# Altium project Proyect Power Supply.PrjPcb
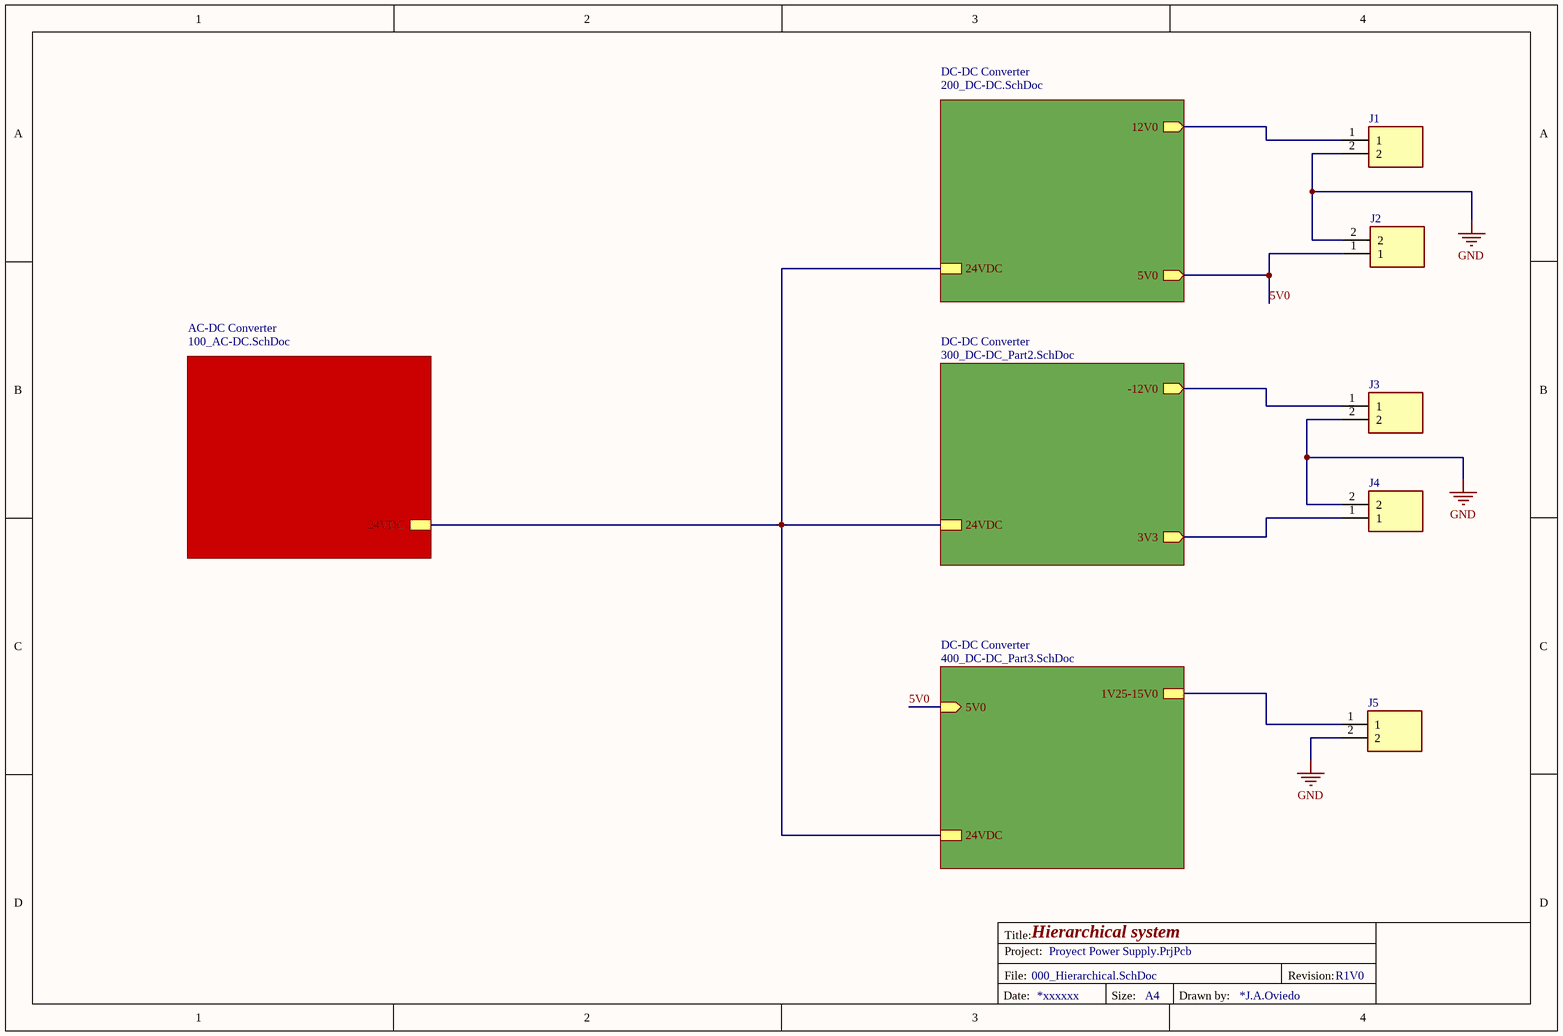
[diagram p0: 000_Hierarchical.SchDoc]
5 sheets, 85 parts. Net scope: hierarchical (ports join the sheet entries above them; power ports are global).
Board file: Main_PCB_V1R0_XXXXXX.PcbDoc
Sheets:
  000_Hierarchical.SchDoc
    AC-DC Converter = 100_AC-DC.SchDoc
    DC-DC Converter = 200_DC-DC.SchDoc
    DC-DC Converter = 300_DC-DC_Part2.SchDoc
    DC-DC Converter = 400_DC-DC_Part3.SchDoc

## Sheet 000_Hierarchical.SchDoc: Hierarchical system
size A4; Date: *xxxxxx; DrawnBy: *J.A.Oviedo; Revision: R1V0; SheetNumber: 1; SheetTotal: 5

### Parts
J1  Con_2*1_TH_5mm_14.3*10.5_300V_15A  [Con_2*1_TH_5mm_14.3*10.5_300V_15A]  (value not drawn)
J2  Con_2*1_TH_5mm_14.3*10.5_300V_15A  [Con_2*1_TH_5mm_14.3*10.5_300V_15A]  (value not drawn)
J3  Con_2*1_TH_5mm_14.3*10.5_300V_15A  [Con_2*1_TH_5mm_14.3*10.5_300V_15A]  (value not drawn)
J4  Con_2*1_TH_5mm_14.3*10.5_300V_15A  [Con_2*1_TH_5mm_14.3*10.5_300V_15A]  (value not drawn)
J5  Con_2*1_TH_5mm_14.3*10.5_300V_15A  [Con_2*1_TH_5mm_14.3*10.5_300V_15A]  (value not drawn)

### Sub-sheets
AC-DC Converter = 100_AC-DC.SchDoc: 24VDC
DC-DC Converter = 200_DC-DC.SchDoc: 24VDC, 12V0 (out), 5V0 (out)
DC-DC Converter = 300_DC-DC_Part2.SchDoc: 24VDC, -12V0 (out), 3V3 (out)
DC-DC Converter = 400_DC-DC_Part3.SchDoc: 24VDC, 1V25-15V0, 5V0 (in)

### Nets
GND: J1.2 J2.2 J3.2 J4.2 J5.2
5V0: J2.1 ; sheet DC-DC Converter/5V0, sheet DC-DC Converter/5V0
NetC104_1: sheet AC-DC Converter/24VDC, sheet DC-DC Converter/24VDC, sheet DC-DC Converter/24VDC, sheet DC-DC Converter/24VDC
NetC204_1: J1.1 ; sheet DC-DC Converter/12V0
NetC305_2: J3.1 ; sheet DC-DC Converter/-12V0
NetC310_1: J4.1 ; sheet DC-DC Converter/3V3
NetC401_2: J5.1 ; sheet DC-DC Converter/1V25-15V0

### Notes on the sheet
- Title:
- Project:
- File:
- Revision:
- Date:
- Size:
- A4
- Drawn by:

### Library data of the parts
J1-J5 = Con_2*1_TH_5mm_14.3*10.5_300V_15A: 2 Bloques de terminales - Cable a placa Horizontal con placa 0.197" (5.00mm) Orificio pasante; Manufacturer: Same Sky (Formerly CUI Devices); Manufacturer Part Number: TB002-500-02BE; Supplier 1: Digi-key; Supplier Part Number 1: 102-6145-ND; Reel Stock: N/A; Last modified by: J.A.Oviedo; Last modified date: 20261021

## Sheet 100_AC-DC.SchDoc: AC-DC Convertion stage
size A4; Date: xxxxxx; DrawnBy: J.A.Oviedo; Revision: R1V1; SheetNumber: 2; SheetTotal: 5
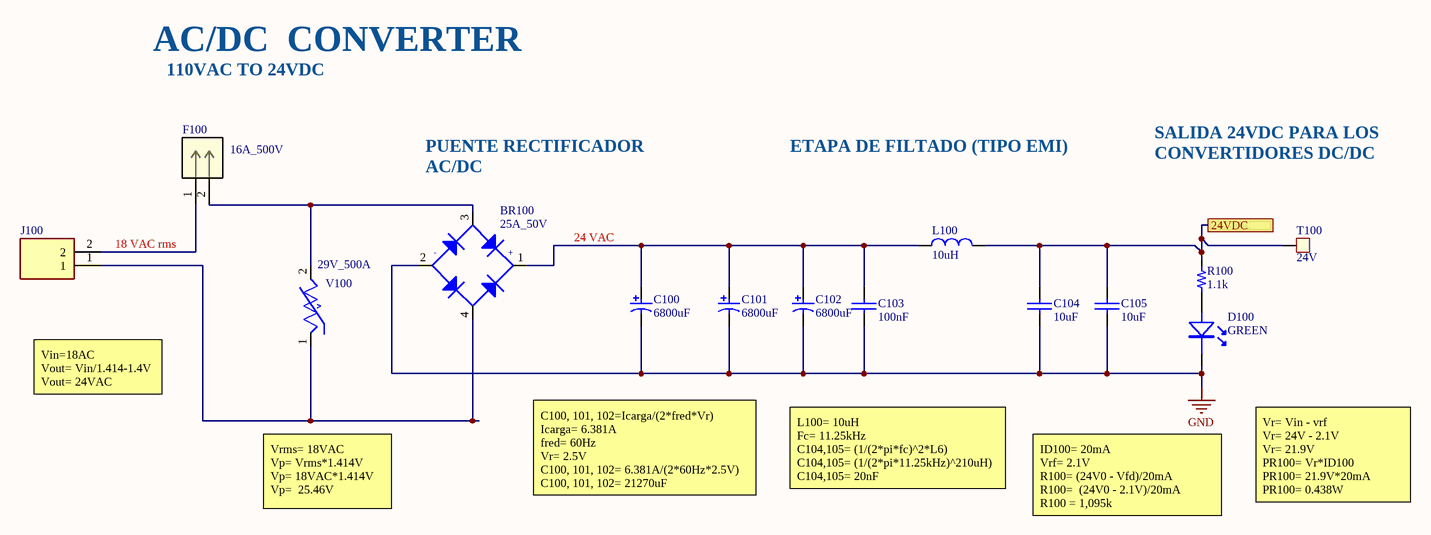
[diagram p1: 100_AC-DC.SchDoc]

### Parts
BR100  25A_50V  [BR_25A_50V_GBJ_Bridge]
C100  value 6800uF  [Cap_6800uF_TH_25*40_50V]  (hidden comment: 6800uF_50V)
C101  value 6800uF  [Cap_6800uF_TH_25*40_50V]  (hidden comment: 6800uF_50V)
C102  value 6800uF  [Cap_6800uF_TH_25*40_50V]  (hidden comment: 6800uF_50V)
C103  value 100nF  [Cap_100nF_X7R-RADIAL_50V]  (hidden comment: 100nF_50V)
C104  value 10uF  [Cap_10uF_X7R_RADIAL_50V]  (hidden comment: 10uF_50V)
C105  value 10uF  [Cap_10uF_X7R_RADIAL_50V]  (hidden comment: 10uF_50V)
D100  GREEN  [LED_TH_5MM_GREEN]
F100  16A_500V  [F_16A_500V_Cartridge_5x20mm_OGN]
J100  Con_2*1_TH_5mm_14.3*10.5_300V_15A  [Con_2*1_TH_5mm_14.3*10.5_300V_15A]  (value not drawn)
L100  value 10uH  [3L_10uH_10A_THT_25*3]  (hidden comment: 10uH_10A)
R100  value 1.1k  [Res_1k1_TH_0.5W]  (hidden comment: 1k1_0.5W)
T100  24V  [TP_SMD_45mil]  (no BOM)
V100  29V_500A  [Var_29V_500A_TH_DISC_10MM]

### Ports
24VDC (see 000_Hierarchical[2C], 200_DC-DC[1A], 300_DC-DC_Part2[1A], 400_DC-DC_Part3[1B])

### Nets
GND: BR100.2 C100.2 C101.2 C102.2 C103.2 C104.2 C105.2 D100.2(K)
NetBR100_1: BR100.1 C100.1 C101.1 C102.1 C103.1 L100.1
NetBR100_3: BR100.3 F100.2 V100.2
NetBR100_4: BR100.4 J100.1 V100.1
NetC104_1: C104.1 C105.1 L100.2 R100.2 T100.1 ; port 24VDC
NetD100_1: D100.1(A) R100.1
NetF100_1: F100.1 J100.2

### Notes on the sheet
- AC/DC  CONVERTER
- 110VAC TO 24VDC
- SALIDA 24VDC PARA LOS
- PUENTE RECTIFICADOR
- (near BR100) AC/DC
- ETAPA DE FILTADO (TIPO EMI)
- CONVERTIDORES DC/DC
- 18 VAC rms
- 24 VAC
- Vin=18AC                                                                                   Vout= Vin/1.414-1.4V
  Vout= 24VAC
- Vrms= 18VAC
  Vp= Vrms*1.414V
  Vp= 18VAC*1.414V
  Vp=  25.46V
- C100, 101, 102=Icarga/(2*fred*Vr)
  Icarga= 6.381A
  fred= 60Hz
  Vr= 2.5V
  C100, 101, 102= 6.381A/(2*60Hz*2.5V)
  C100, 101, 102= 21270uF
- L100= 10uH
  Fc= 11.25kHz
  C104,105= (1/(2*pi*fc)^2*L6)
  C104,105= (1/(2*pi*11.25kHz)^210uH)
  C104,105= 20nF
- ID100= 20mA
  Vrf= 2.1V
  R100= (24V0 - Vfd)/20mA
  R100=  (24V0 - 2.1V)/20mA
  R100 = 1,095k
- Vr= Vin - vrf
  Vr= 24V - 2.1V
  Vr= 21.9V
  PR100= Vr*ID100
  PR100= 21.9V*20mA
  PR100= 0.438W
- Title:
- Project:
- File:
- Revision:
- Date:
- Size:
- A4
- Drawn by:
- (in symbol BR_25A_50V_GBJ_Bridge) -; +

### Library data of the parts
BR100 = BR_25A_50V_GBJ_Bridge: BRIDGE RECT 1PHASE 50V 25A TS-6P; Manufacturer: onsemi; Manufacturer Part Number: DFB2505; Supplier 1: Digi-Key; Supplier Part Number 1: DFB2505-ND; Reel Stock: N/A; Last modified by: J.A.Oviedo; Last modified date: 20261022; ComponentLink1Description: Digi-Key; ComponentLink1URL: https://www.digikey.com/product-detail/en/smc-diode-solutions/KMB24STR/1655-1884-1-ND/7898353
C100-C102 = Cap_6800uF_TH_25*40_50V: CAP ALUM 6800UF 20% 50V SNAP TH; Manufacturer: Cornell Dubilier Knowles; Manufacturer Part Number: SLPX682M050C7P3; Last modified by: J.A.Oviedo; Last modified date: 2026/10/22; ComponentLink1Description: Digi-Key; ComponentLink1URL: https://www.digikey.com/products/en?keywords=493-10137-1-ND; Supplier 1: Digi-Key; Supplier Part Number 1: SLPX682M050C7P3
C103 = Cap_100nF_X7R-RADIAL_50V: CAP CER 0.1UF 50V X7R RADIAL; Manufacturer: KEMET; Manufacturer Part Number: C320C104K5R5TA; Supplier 1: Digi-Key; Supplier Part Number 1: 399-4264-ND; Last modified by: J.A.Oviedo; Last modified date: 20261022
C104 C105 = Cap_10uF_X7R_RADIAL_50V: 10 µF ±10% 50V Capacitores cerámicos X7R Radial; Manufacturer: TDK; Manufacturer Part Number: FG20X7R1H106KRT06; Supplier 1: Digi-Key; Supplier Part Number 1: 445-173297-1-ND; Last modified by: J.A.Oviedo; Last modified date: 20261022
D100 = LED_TH_5MM_GREEN: LED GREEN DIFFUSED 5MM ROUND T/H; Manufacturer: Würth Elektronik; Manufacturer Part Number: 151051VS04000; Supplier 1: Digi-key; Supplier Part Number 1: 732-5017-ND; Last modified by: J.A.Oviedo; Last modified date: 20261022; Reel Stock: N/A; ComponentLink1Description: Digi-key; ComponentLink1URL: https://www.digikey.tw/products/en?keywords=511-1635-1-ND
F100 = F_16A_500V_Cartridge_5x20mm_OGN: Fusible Bloque 16 A 500V 1 Circuitos Cartucho Orificio pasante; Manufacturer: SCHURTER Inc.; Manufacturer Part Number: 3-132-874; Supplier 1: Digi-key; Supplier Part Number 1: 486-3-132-874-ND; Reel Sotck: N/A; Last modified by: J.A.Oviedo; Last modified date: 20261021
J100 = Con_2*1_TH_5mm_14.3*10.5_300V_15A: as J1 on sheet 000_Hierarchical; Supplier 1: Digi-key; Supplier Part Number 1: 102-6145-ND; Reel Stock: N/A; Last modified by: J.A.Oviedo; Last modified date: 20261021
L100 = L_10uH_10A_THT_25*3: 10 µH No blindado Núcleo de tambor, cableado Inductivo 10 A 8.8mOhm Cilindro radial y horizontal (abierto); Manufacturer: Würth Elektronik; Manufacturer Part Number: 744711010; Supplier 1: Digy-key; Supplier Part Number 1: 732-3259-ND; Reel Stock: N/A; Last modified by: J.A.Oviedo; Last modified date: 20261022
R100 = Res_1k1_TH_0.5W: RES 1.1kΩ ±1% 500mW Through Hole,D2.4xL6.3mm; Manufacturer: YAGEO; Manufacturer Part Number: MFR50SFTE52-1K1; Supplier 1: LCSC; Supplier Part Number 1: YAGEO MFR50SFTE52-1K1; Reel Stock: N/A; Last modified by: J.A.Oviedo; Last modified date: 20261023
T100 = TP_SMD_45mil: Test point 45mil pad size; Last modified by: J.Jaramillo; Last modified date: 20240310
V100 = Var_29V_500A_TH_DISC_10MM: 39 V 500 A Varistor 1 Circuitos Orificio pasante Tipo moneda 10mm; Manufacturer: TDK; Manufacturer Part Number: B72210S0250K101; Supplier 1: Digi-key; Supplier Part Number 1: 495-3768-ND; Reel Sotck: N/A; Last modified by: J.Jaramillo; Last modified date: 20240309

## Sheet 200_DC-DC.SchDoc: DC-DC Convertion stage
size A4; Date: xxxxxx; DrawnBy: J.A.Oviedo; Revision: R1V1; SheetNumber: 3; SheetTotal: 5
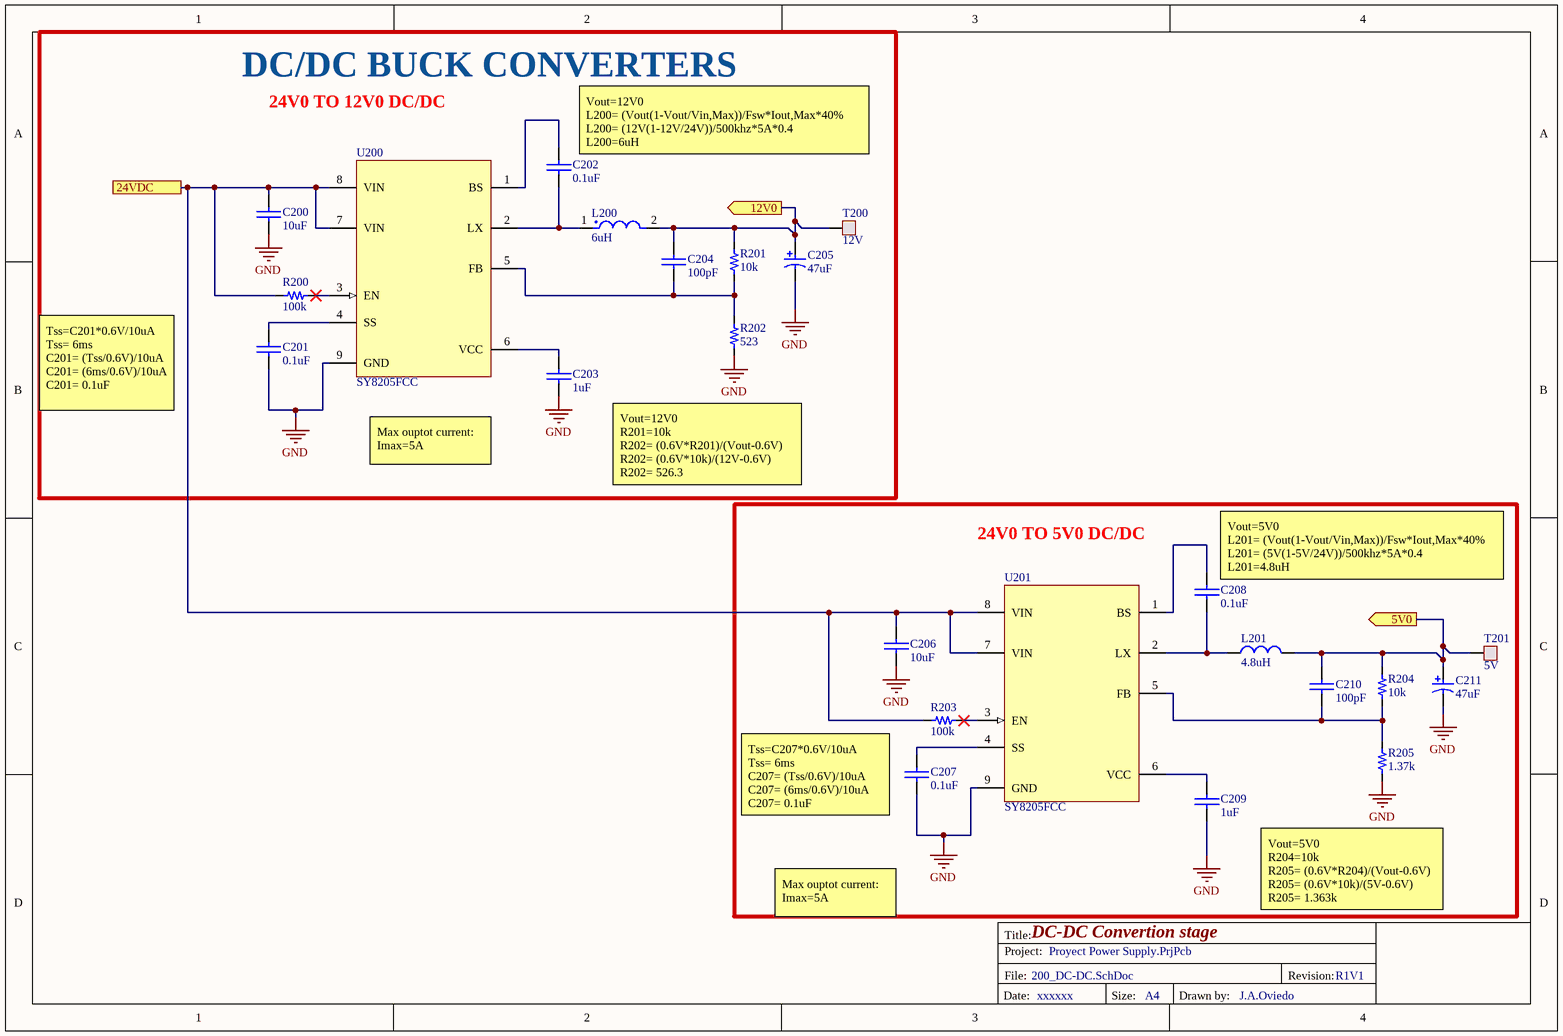
[diagram p2: 200_DC-DC.SchDoc]

### Parts
C200  value 10uF  [1206]  (hidden comment: 10uF 50V)
C201  value 0.1uF  [0603]  (hidden comment: 0.1uF 50V)
C202  value 0.1uF  [0603]  (hidden comment: 0.1uF 50V)
C203  value 1uF  [0805]  (hidden comment: 1uF 25V)
C204  value 100pF  [0201]  (hidden comment: 100pF 25V)
C205  value 47uF  [RADIAL-CAN_LSx2.54mm_Diax6.35mm]  (hidden comment: 47uF 25V)
C206  value 10uF  [1206]  (hidden comment: 10uF 50V)
C207  value 0.1uF  [0603]  (hidden comment: 0.1uF 50V)
C208  value 0.1uF  [0603]  (hidden comment: 0.1uF 50V)
C209  value 1uF  [0805]  (hidden comment: 1uF 25V)
C210  value 100pF  [0201]  (hidden comment: 100pF 25V)
C211  value 47uF  [RADIAL-CAN_LSx2.54mm_Diax6.35mm]  (hidden comment: 47uF 25V)
L200  value 6uH  [L_6uH_9.4A_CSCM1256]  (hidden comment: CSCM1256-6R0M)
L201  value 4.8uH  [L_4.8uH_11A_1312]  (hidden comment: 4.8uH_11A)
R200  value 100k  [0603]  (hidden comment: 100k 1/10W)
R201  value 10k  [0603]  (hidden comment: 10k 1/10W)
R202  value 523  [Res_523_0603_0.1W]  (hidden comment: 523_0.1W)
R203  value 100k  [0603]  (hidden comment: 100k 1/10W)
R204  value 10k  [0603]  (hidden comment: 10k 1/10W)
R205  value 1.37k  [Res_1.37k_0603_0.1W]  (hidden comment: 1.37k_0.1W)
T200  12V  [TP_SMD_45mil]  (no BOM)
T201  5V  [TP_SMD_45mil]  (no BOM)
U200  SY8205FCC  [SOIC127P600X160_HS-9N]
U201  SY8205FCC  [SOIC127P600X160_HS-9N]

### Blocks framed on the sheet
DC/DC BUCK CONVERTERS: C200-C205 L200 R200-R202 T200 U200
24V0 TO 5V0 DC/DC: C206-C211 L201 R203-R205 T201 U201

### Ports
5V0 (out, see 000_Hierarchical[4B], 400_DC-DC_Part3[3B]), 12V0 (out, see 000_Hierarchical[4A]), 24VDC (see 000_Hierarchical[3B], 100_AC-DC[4B], 300_DC-DC_Part2[1A], 400_DC-DC_Part3[1B])

### Nets
GND: C200.2 C201.2 C203.2 C205.2 C206.2 C207.2 C209.2 C211.2 R202.2 R205.1 U200.9(GND) U201.9(GND)
5V0: C210.1 C211.1 L201.2 R204.2 T201.1 ; port 5V0
NetC104_1: C200.1 C206.1 R200.1 R203.1 U200.7(VIN) U200.8(VIN) U201.7(VIN) U201.8(VIN) ; port 24VDC
NetC201_1: C201.1 U200.4(SS)
NetC202_1: C202.1 U200.1(BS)
NetC202_2: C202.2 L200.1 U200.2(LX)
NetC203_1: C203.1 U200.6(VCC)
NetC204_1: C204.1 C205.1 L200.2 R201.2 T200.1 ; port 12V0
NetC204_2: C204.2 R201.1 R202.1 U200.5(FB)
NetC207_1: C207.1 U201.4(SS)
NetC208_1: C208.1 U201.1(BS)
NetC208_2: C208.2 L201.1 U201.2(LX)
NetC209_1: C209.1 U201.6(VCC)
NetC210_2: C210.2 R204.1 R205.2 U201.5(FB)
NetR200_2: R200.2 U200.3(EN)
NetR203_2: R203.2 U201.3(EN)

### Notes on the sheet
- 24V0 TO 12V0 DC/DC
- (near C202) Vout=12V0                                                                                   L200= (Vout(1-Vout/Vin,Max))/Fsw*Iout,Max*40%
  L200= (12V(1-12V/24V))/500khz*5A*0.4                L200=6uH
- Tss=C201*0.6V/10uA
  Tss= 6ms                     C201= (Tss/0.6V)/10uA        C201= (6ms/0.6V)/10uA       C201= 0.1uF
- Max ouptot current: Imax=5A
- Vout=12V0                                       R201=10k                                            R202= (0.6V*R201)/(Vout-0.6V)
  R202= (0.6V*10k)/(12V-0.6V)             R202= 526.3
- (near C208) Vout=5V0                                                                                   L201= (Vout(1-Vout/Vin,Max))/Fsw*Iout,Max*40%
  L201= (5V(1-5V/24V))/500khz*5A*0.4                L201=4.8uH
- (near C207) Tss=C207*0.6V/10uA
  Tss= 6ms                     C207= (Tss/0.6V)/10uA        C207= (6ms/0.6V)/10uA       C207= 0.1uF
- Vout=5V0                                       R204=10k                                            R205= (0.6V*R204)/(Vout-0.6V)
  R205= (0.6V*10k)/(5V-0.6V)             R205= 1.363k
- Title:
- Project:
- File:
- Revision:
- Date:
- Size:
- A4
- Drawn by:

### Library data of the parts
C200 C206 = Cap_10uF_1206_50V: CAP CER 10UF 50V X5R 1206; Manufacturer: Murata Electronics North America; Manufacturer Part Number: GRT31CR61H106ME01L; Last modified by: J.Jaramillo; Last modified date: 20240309; ComponentLink1Description: Digi-Key; ComponentLink1URL: https://www.digikey.com/product-detail/en/murata-electronics-north-america/GRT31CR61H106ME01L/490-12457-1-ND/5417158; Supplier 1: Digi-Key; Supplier Part Number 1: 490-12457-1-ND
C201 C202 C207 C208 = Cap_0.1uF_0603_50V: CAP CER 0.1UF 50V X7R 0603; Manufacturer: Samsung Electro-Mechanics; Manufacturer Part Number: CL10B104JB8NNNC; Supplier 1: Digi-Key; Supplier Part Number 1: 1276-1033-1-ND; Last modified by: J.Jaramillo; Last modified date: 20240309; ComponentLink1Description: Digi-key; ComponentLink1URL: https://www.digikey.com/en/products/detail/samsung-electro-mechanics/CL10B104JB8NNNC/3886691?s=N4IgTCBcDaIIxgOwDYC0cAMBmL7UDkAREAXQF8g
C203 C209 = Cap_1uF_0805_25V: CAP CER 1UF 25V X7R 0805; Manufacturer: Yageo; Manufacturer Part Number: CC0805KKX7R8BB105; Supplier 1: Digi-Key; Supplier Part Number 1: 311-1456-1-ND; Last modified by: J.Jaramillo; Last modified date: 20240309; ComponentLink1Description: Digi-Key; ComponentLink1URL: https://www.digikey.com/product-detail/en/yageo/CC0805KKX7R8BB105/311-1456-1-ND/2833762
C204 C210 = Cap_100pF_0201_25V: CAP CER 100PF 25V NP0 0201; Manufacturer: Murata Electronics; Manufacturer Part Number: GRM0335C1E101GA01D; Supplier 1: Digi-Key; Supplier Part Number 1: 490-17802-1-ND; Last modified by: J.Jaramillo; Last modified date: 20240309; ComponentLink1Description: Digi-Key; ComponentLink1URL: https://www.digikey.com/en/products/detail/murata-electronics/GRM0335C1E101GA01D/4358566?s=N4IgTCBcDaIOICUCyAGAzGgrAYQIwFFcVc4BBYgERAF0BfIA
C205 C211 = Cap_47uF_25V_ALU_THT: CAP 47uf/25V,10*16,105℃ RADIAL; Manufacturer: SamXon; Manufacturer Part Number: KM 47U/25V; Last modified by: J.Jaramillo; Last modified date: 20240309; Supplier 1: Poshton; Supplier Part Number 1: KM 47U/25V; ComponentLink1Description: Datasheet; ComponentLink1URL: CMP000351_KM-Series
L200 = L_6uH_9.4A_CSCM1256: FIXED IND 6UH 9.4A 6.27 MOHM SMD; Manufacturer: CODACA; Manufacturer Part Number: CSCM1256-6R0M; Supplier 1: Digi-key; Supplier Part Number 1: 4044-CSCM1256-6R0MCT-ND; Reel Stock: N/A; Last modified by: J.A.Oviedo; Last modified date: 20261019
L201 = L_4.8uH_11A_1312: 11A 4.8uH ±20% 11.55mΩ 13A Molded inductor SMD,13x12.8mm Fixed Inductors; Manufacturer: Coilank; Manufacturer Part Number: APZBX1250M4R8; Supplier 1: LCSC; Supplier Part Number 1: C54623473; Reel Stock: N/A; Last modified by: J.A.Oviedo; Last modified date: 20261020
R200 R203 = Res_100k_0603_1/10W: RES 100k OHM 1% 1/10W 0603; Manufacturer: Stackpole Electronics Inc.; Manufacturer Part Number: RMCF0603FT100K; Supplier 1: Digi-Key; Supplier Part Number 1: RMCF0603FT100KCT-ND; Reel Stock: N/A; Last modified by: J.Jaramillo; Last modified date: 20240310; ComponentLink1Description: Digi-Key; ComponentLink1URL: https://www.digikey.com/product-detail/en/stackpole-electronics-inc/RMCF0603FT100K/RMCF0603FT100KCT-ND/1943118
R201 R204 = Res_10k_0603_1/10W: RES SMD 10K OHM 1% 1/10W 0603; Manufacturer: Samsung Electro-Mechanics; Manufacturer Part Number: RC1608F103CS; ComponentLink1URL: https://www.digikey.com/products/en?keywords=1276-3485-1-ND; Supplier 1: Digi-Key; Supplier Part Number 1: 1276-3485-1-ND; Reel Stock: N/A; Last modified by: J.Jaramillo; Last modified date: 20240310; ComponentLink1Description: Digi-key
R202 = Res_523_0603_0.1W: RES 523 OHM 1% 1/10W 0603; Manufacturer: YAGEO; Manufacturer Part Number: RC0603FR-07523RL; Supplier 1: Digi-key; Supplier Part Number 1: 311-523HRCT-ND; Reel Stock: N/A; Last modified by: J.A.Oviedo; Last modified date: 20261016
R205 = Res_1.37k_0603_0.1W: Fixed Resistor, Metal Glaze/thick Film, 0.1W, 1370ohm, 75V, 1% +/-Tol, 100ppm/Cel, Surface Mount, 0603; Power Rating: 100mW; Temperature Coefficient: 100ppm/°C; Reel Stock: N/A; Last modified by: J.A.Oviedo; Last modified date: 20261020; ComponentLink1Description: New link; ComponentLink1URL: *; Supplier: Mouser; Supplier Part Number: 603-AF0603FR-071K37L; RoHS: Compliant; Category: Chip SMD Resistors; Stock: 7115; Pricing: 1=0,1, 10=0,022, 50=0,022, 100=0,016, 1000=0,012, 10000=0,008 (USD); Case/Package: 0603; China RoHS: Non-Compliant; Composition: Thick Film; Country of Origin: Mainland China, Taiwan; Export Control Classification Number (ECCN) Code: EAR99; Height: 450µm; Harmonized Tariff Schedule (HTS) Code: 8533.21.00.30; Introduction Date: 2012-05-08; Length: 1.6mm; Lifecycle Status: Production; Max Operating Temperature: 155°C; Min Operating Temperature: -55°C; Mounting Technology: Surface Mount; Number of Terminals: 2; Packaging: Tape & Reel; Ratings: AEC-Q200; REACH SVHC: Unaffected; Tolerance: 1%; Voltage Rating: 75V; Width: 800µm; Working Voltage: 75V; ComponentLink2URL: https://datasheet.octopart.com:443/AF0603FR-071K37L-Yageo-datasheet-182189395.pdf?src-supplier=IHS; ComponentLink2Description: https://datasheet.octopart.com:443/AF0603FR-071K37L-Yageo-datasheet-182189395.pdf?src-supplier=IHS; ComponentLink3URL: https://datasheet.octopart.com:443/AF0603FR-071K37L-Yageo-datasheet-153645569.pdf?src-supplier=Upverter; ComponentLink3Description: https://datasheet.octopart.com:443/AF0603FR-071K37L-Yageo-datasheet-153645569.pdf?src-supplier=Upverter; ComponentLink4URL: https://sigma.octopart.com:443/138820526/technical_drawing/Yageo-AF0603FR-071K37L.pdf?src-supplier=Upverter; ComponentLink4Description: https://sigma.octopart.com:443/138820526/technical_drawing/Yageo-AF0603FR-071K37L.pdf?src-supplier=Upverter; ComponentLink5URL: https://datasheet.octopart.com/AF0603FR-071K37L-Yageo-datasheet-68296209.pdf; ComponentLink5Description: https://datasheet.octopart.com/AF0603FR-071K37L-Yageo-datasheet-68296209.pdf; ComponentLink6URL: http://sigma.octopart.com:80/conflict_mineral_statement/Yageo-company-3.pdf?src-supplier=Compliance+Statements; ComponentLink6Description: http://sigma.octopart.com:80/conflict_mineral_statement/Yageo-company-3.pdf?src-supplier=Compliance+Statements; ComponentLink7URL: http://sigma.octopart.com:80/rohs_statement/Yageo-company-2.pdf?src-supplier=Compliance+Statements; ComponentLink7Description: http://sigma.octopart.com:80/rohs_statement/Yageo-company-2.pdf?src-supplier=Compliance+Statements; Supplier 1: Mouser; Supplier Part Number 1: 603-AF0603FR-071K37L
T200 T201 = TP_SMD_45mil: Test point 45mil pad size; Last modified by: J.Jaramillo; Last modified date: 20240310
U200 U201 = DC/DC_ADJ_5A_SOIC-8-EP: High Efficiency Fast Response, 5A, 30V Input Synchronous Step Down Regulator; Manufacturer: Silergy; Manufacturer Part Number: SY8205FCC; Supplier 1: LCSC; Supplier Part Number 1: C111875; Reel Stock: N/A; Last modified by: J.A.OVIEDO; Last modified date: 20261018; ComponentLink1Description: LCSC; ComponentLink1URL: https://www.lcsc.com/es/product-detail/C111875.html?s_z=n_q_SY8205FCC; ComponentLink2Description: DATASHEET; ComponentLink2URL: https://www.lcsc.com/datasheet/C111875.pdf

## Sheet 300_DC-DC_Part2.SchDoc: *DC-DC Convertion stage
size A4; Date: xxxxxx; DrawnBy: J.A.Oviedo; Revision: *R1V1; SheetNumber: 4; SheetTotal: 5
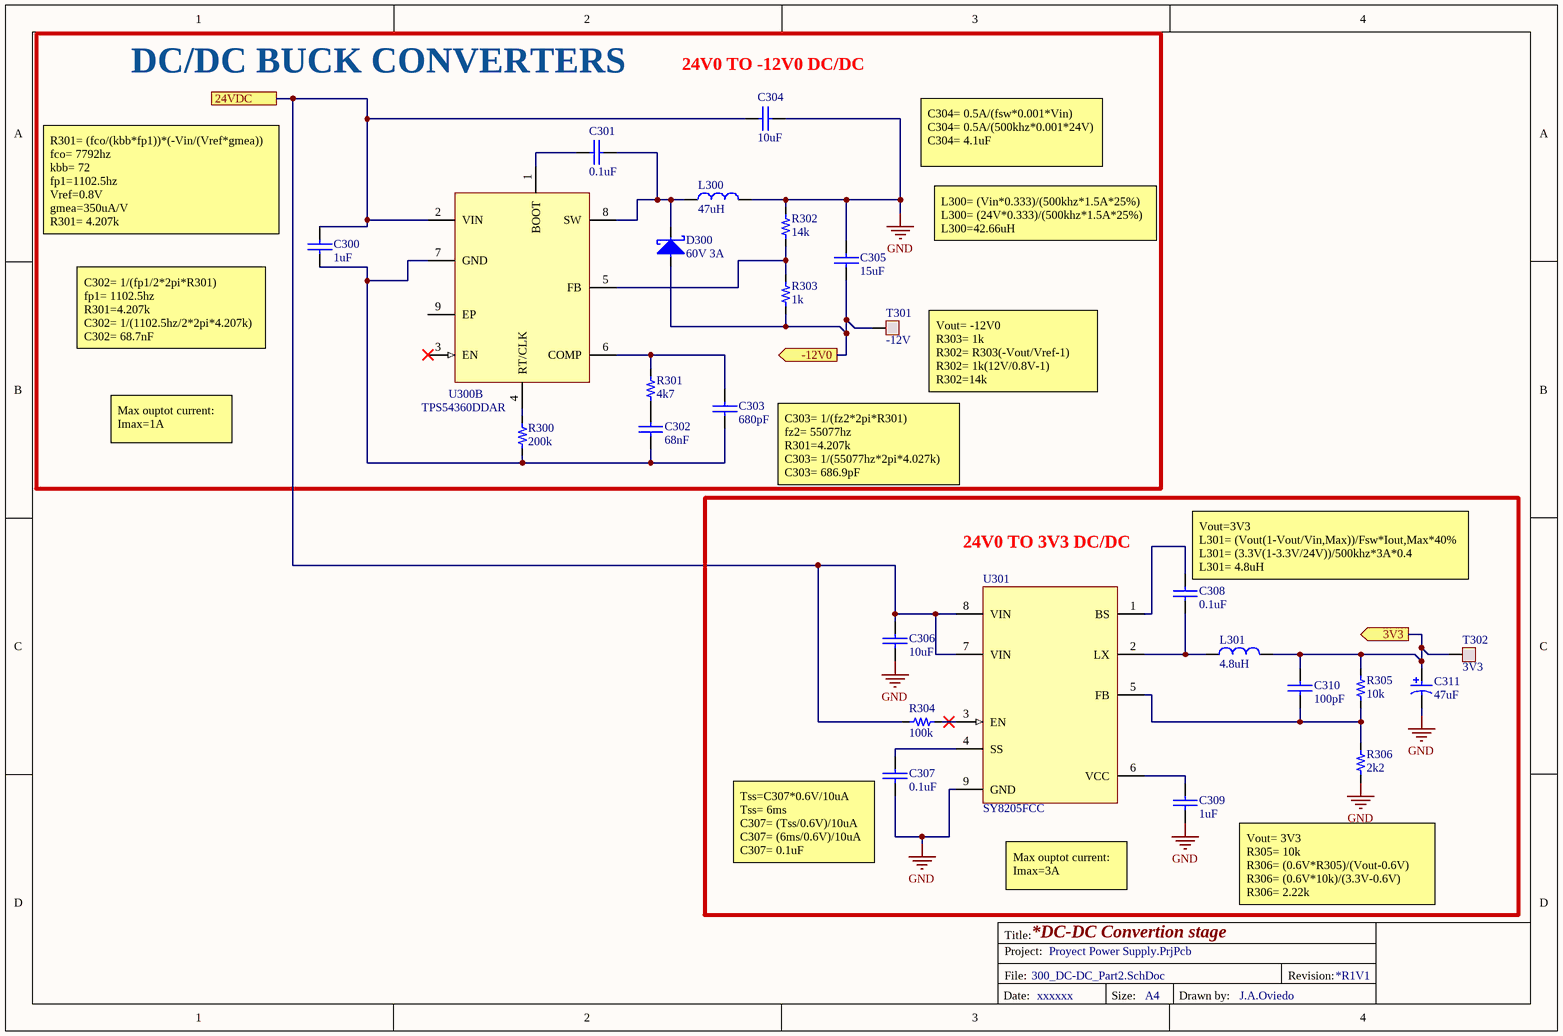
[diagram p3: 300_DC-DC_Part2.SchDoc]

### Parts
C300  value 1uF  [Cap_1uF_0603_X5R_50V]  (hidden comment: 1uF_50V)
C301  value 0.1uF  [0402_RF]  (hidden comment: 100nF 25V)
C302  value 68nF  [0603_1.4mm]  (hidden comment: 0.068uF 50V)
C303  value 680pF  [0603]  (hidden comment: 680pF 50V)
C304  value 10uF  [1206]  (hidden comment: 10uF 50V)
C305  value 15uF  [Cap_15uF_X5R-0805_25V]  (hidden comment: 15uF_25V)
C306  value 10uF  [1206]  (hidden comment: 10uF 50V)
C307  value 0.1uF  [0603]  (hidden comment: 0.1uF 50V)
C308  value 0.1uF  [0603]  (hidden comment: 0.1uF 50V)
C309  value 1uF  [0805]  (hidden comment: 1uF 25V)
C310  value 100pF  [0201]  (hidden comment: 100pF 25V)
C311  value 47uF  [RADIAL-CAN_LSx2.54mm_Diax6.35mm]  (hidden comment: 47uF 25V)
D300  60V 3A  [DO_214AC]
L300  value 47uH  [L-SMD_47uH_2.6A_12.5*12.5]  (hidden comment: 47uH_2.6A)
L301  value 4.8uH  [L_4.8uH_11A_1312]  (hidden comment: 4.8uH_11A)
R300  value 200k  [0603]  (hidden comment: 200k 1/10W)
R301  value 4k7  [0603]  (hidden comment: 4k7 1/10W)
R302  value 14k  [Res_14k_0603-SMD_0.125W]  (hidden comment: 14K_0.125W)
R303  value 1k  [0603]  (hidden comment: 1k 1/10W)
R304  value 100k  [0603]  (hidden comment: 100k 1/10W)
R305  value 10k  [0603]  (hidden comment: 10k 1/10W)
R306  value 2k2  [0603]  (hidden comment: 2k2 1/10W)
T301  -12V  [TP_SMD_45mil]  (no BOM)
T302  3V3  [TP_SMD_45mil]  (no BOM)
U300  TPS54360DDAR  [SOIC127P600X170_HS-9N]  (part B of 2)
U301  SY8205FCC  [SOIC127P600X160_HS-9N]

### Blocks framed on the sheet
DC/DC BUCK CONVERTERS: C300-C305 D300 L300 R300-R303 T301 U300
24V0 TO 3V3 DC/DC: C306-C311 L301 R304-R306 T302 U301

### Ports
3V3 (out, see 000_Hierarchical[4C]), 24VDC (see 000_Hierarchical[3C], 100_AC-DC[4B], 200_DC-DC[1A], 400_DC-DC_Part3[1B]), -12V0 (out, see 000_Hierarchical[4B])

### Nets
GND: C304.2 C305.1 C306.2 C307.2 C309.2 C311.2 L300.2 R302.2 R306.1 U301.9(GND)
NetC104_1: C300.1 C304.1 C306.1 R304.1 U300.2(VIN) U301.7(VIN) U301.8(VIN) ; port 24VDC
NetC300_2: C300.2 C302.2 C303.2 R300.1 U300.7(GND)
NetC301_1: C301.1 D300.1 L300.1 U300.8(SW)
NetC301_2: C301.2 U300.1(BOOT)
NetC302_1: C302.1 R301.1
NetC303_1: C303.1 R301.2 U300.6(COMP)
NetC305_2: C305.2 D300.2 R303.1 T301.1 ; port -12V0
NetC307_1: C307.1 U301.4(SS)
NetC308_1: C308.1 U301.1(BS)
NetC308_2: C308.2 L301.1 U301.2(LX)
NetC309_1: C309.1 U301.6(VCC)
NetC310_1: C310.1 C311.1 L301.2 R305.2 T302.1 ; port 3V3
NetC310_2: C310.2 R305.1 R306.2 U301.5(FB)
NetR300_2: R300.2 U300.4(RT/CLK)
NetR302_1: R302.1 R303.2 U300.5(FB)
NetR304_2: R304.2 U301.3(EN)

Not connected (* = marked no-connect by the designer): U300 3(EN)* 9(EP)

### Notes on the sheet
- (near C304) 24V0 TO -12V0 DC/DC
- C304= 0.5A/(fsw*0.001*Vin)
  C304= 0.5A/(500khz*0.001*24V)
  C304= 4.1uF
- (near C300) R301= (fco/(kbb*fp1))*(-Vin/(Vref*gmea))
  fco= 7792hz
  kbb= 72
  fp1=1102.5hz
  Vref=0.8V
  gmea=350uA/V
  R301= 4.207k
- L300= (Vin*0.333)/(500khz*1.5A*25%)
  L300= (24V*0.333)/(500khz*1.5A*25%)
  L300=42.66uH
- C302= 1/(fp1/2*2pi*R301)
  fp1= 1102.5hz
  R301=4.207k
  C302= 1/(1102.5hz/2*2pi*4.207k)
  C302= 68.7nF
- Max ouptot current: Imax=1A
- (near T301) Vout= -12V0                                       R303= 1k                                            R302= R303(-Vout/Vref-1)
  R302= 1k(12V/0.8V-1)
  R302=14k
- C303= 1/(fz2*2pi*R301)
  fz2= 55077hz
  R301=4.207k
  C303= 1/(55077hz*2pi*4.027k)
  C303= 686.9pF
- (near C308) Vout=3V3                                                                                   L301= (Vout(1-Vout/Vin,Max))/Fsw*Iout,Max*40%
  L301= (3.3V(1-3.3V/24V))/500khz*3A*0.4                L301= 4.8uH
- (near C307) Tss=C307*0.6V/10uA
  Tss= 6ms                     C307= (Tss/0.6V)/10uA        C307= (6ms/0.6V)/10uA       C307= 0.1uF
- Max ouptot current: Imax=3A
- Vout= 3V3                                       R305= 10k                                            R306= (0.6V*R305)/(Vout-0.6V)
  R306= (0.6V*10k)/(3.3V-0.6V)             R306= 2.22k
- Title:
- Project:
- File:
- Revision:
- Date:
- Size:
- A4
- Drawn by:

### Library data of the parts
C300 = Cap_1uF_0603_X5R_50V: C0603X5R500-105KNP-CT; Manufacturer: Venkel; Manufacturer Part Number: C0603X5R500-105KNP-CT; Supplier 1: Digi-Key; Supplier Part Number 1: 2679-C0603X5R500-105KNP-CT-ND; Last modified by: J.A.Oviedo; Last modified date: 20261021
C301 = Cap_0.1uF_0402_25V: CAP CER 0.1UF 25V X7R 0402; Manufacturer: Yageo; Manufacturer Part Number: CC0402KRX7R8BB104; Last modified by: J.Jaramillo; Last modified date: 20240309; ComponentLink1Description: Digi-key; ComponentLink1URL: https://www.digikey.com/products/en?keywords=311-2077-1-ND; Supplier 1: Digi-Key; Supplier Part Number 1: 311-2077-1-ND
C302 = Cap_0.068uF_0603_50V: CAP CER 0.068UF 50V X7R 0603; Manufacturer: Samsung Electro-Mechanics; Manufacturer Part Number: CL10B683KB8NNNC; Reel stock: N/A; Last modified by: J.Jaramillo; Last modified date: 20240309; ComponentLink1Description: Digi-key; ComponentLink1URL: https://www.digikey.com/product-detail/en/samsung-electro-mechanics/CL10B683KB8NNNC/1276-1814-1-ND/3889900; Supplier 1: Digi-Key; Supplier Part Number 1: 1276-1814-1-ND
C303 = Cap_680pF_0603_50V: CAP CER 680PF 50V X7R 0603; Manufacturer: KEMET; Manufacturer Part Number: C0603C681K5RAC7867; Supplier 1: Digi-Key; Supplier Part Number 1: 399-C0603C681K5RAC7867CT-ND; Last modified by: J.Jaramillo; Last modified date: 20240309; ComponentLink1Description: Digi-Key; ComponentLink1URL: https://www.digikey.com/en/products/detail/kemet/C0603C681K5RAC7867/411079
C304 C306 = Cap_10uF_1206_50V: as C200 on sheet 200_DC-DC; Last modified by: J.Jaramillo; Last modified date: 20240309; ComponentLink1Description: Digi-Key; ComponentLink1URL: https://www.digikey.com/product-detail/en/murata-electronics-north-america/GRT31CR61H106ME01L/490-12457-1-ND/5417158; Supplier 1: Digi-Key; Supplier Part Number 1: 490-12457-1-ND
C305 = Cap_15uF_X5R-0805_25V: CAP CER 15UF 25V X5R 0805; Manufacturer: TDK; Manufacturer Part Number: C2012X5R1E156M125AC; Supplier 1: Digi-Key; Supplier Part Number 1: 445-9078-1-ND; Last modified by: J.A.Oviedo; Last modified date: 20261021
C307 C308 = Cap_0.1uF_0603_50V: as C201 on sheet 200_DC-DC; Supplier 1: Digi-Key; Supplier Part Number 1: 1276-1033-1-ND; Last modified by: J.Jaramillo; Last modified date: 20240309; ComponentLink1Description: Digi-key; ComponentLink1URL: https://www.digikey.com/en/products/detail/samsung-electro-mechanics/CL10B104JB8NNNC/3886691?s=N4IgTCBcDaIIxgOwDYC0cAMBmL7UDkAREAXQF8g
C309 = Cap_1uF_0805_25V: as C203 on sheet 200_DC-DC; Supplier 1: Digi-Key; Supplier Part Number 1: 311-1456-1-ND; Last modified by: J.Jaramillo; Last modified date: 20240309; ComponentLink1Description: Digi-Key; ComponentLink1URL: https://www.digikey.com/product-detail/en/yageo/CC0805KKX7R8BB105/311-1456-1-ND/2833762
C310 = Cap_100pF_0201_25V: as C204 on sheet 200_DC-DC; Supplier 1: Digi-Key; Supplier Part Number 1: 490-17802-1-ND; Last modified by: J.Jaramillo; Last modified date: 20240309; ComponentLink1Description: Digi-Key; ComponentLink1URL: https://www.digikey.com/en/products/detail/murata-electronics/GRM0335C1E101GA01D/4358566?s=N4IgTCBcDaIOICUCyAGAzGgrAYQIwFFcVc4BBYgERAF0BfIA
C311 = Cap_47uF_25V_ALU_THT: as C205 on sheet 200_DC-DC; Last modified by: J.Jaramillo; Last modified date: 20240309; Supplier 1: Poshton; Supplier Part Number 1: KM 47U/25V; ComponentLink1Description: Datasheet; ComponentLink1URL: CMP000351_KM-Series
D300 = D_Schottky_60V_3A_DO_214AC: DIODE SCHOTTKY 60V 3A DO214AC; Manufacturer: Taiwan Semiconductor Corporation; Manufacturer Part Number: TSSA3U60 R3G; Reel Stock: N/A; Last modified by: J.Jaramillo; Last modified date: 20240310; Supplier 1: Digi-Key; Supplier Part Number 1: TSSA3U60R3GCT-ND; ComponentLink1Description: Digi-Key; ComponentLink1URL: https://www.digikey.com/products/en?keywords=TSSA3U60R3GCT-ND
L300 = L-SMD_47uH_2.6A_12.5*12.5: FIXED IND 47UH 2.6A 86 MOHM SMD; Manufacturer: Bourns Inc.; Manufacturer Part Number: SRR1260-470M; Supplier 1: Digi-key; Supplier Part Number 1: SRR1260-470MCT-ND; Reel Stock: N/A; Last modified by: J.A.Oviedo; Last modified date: 20261021
L301 = L_4.8uH_11A_1312: as L201 on sheet 200_DC-DC; Supplier 1: LCSC; Supplier Part Number 1: C54623473; Reel Stock: N/A; Last modified by: J.A.Oviedo; Last modified date: 20261020
R300 = Res_200k_0603_1/10W: RES 200K OHM 1% 1/10W 0603; Manufacturer: Stackpole Electronics Inc; Manufacturer Part Number: RMCF0603FT200K; Supplier 1: Digi-Key; Supplier Part Number 1: RMCF0603FT200KCT-ND; Reel Stock: N/A; Last modified by: J.Jaramillo; Last modified date: 20240310; ComponentLink1Description: Digi-Key; ComponentLink1URL: https://www.digikey.com/en/products/detail/stackpole-electronics-inc/RMCF0603FT200K/1760715
R301 = Res_4k7_0603_1/10W: RES SMD 4.7K OHM 1% 1/10W 0603; Manufacturer: Yageo; Manufacturer Part Number: RC0603FR-074K7L; Supplier 1: Digi-Key; Supplier Part Number 1: 311-4.70KHRCT-ND; Reel Stock: N/A; Last modified by: J.Jaramillo; Last modified date: 20240310; ComponentLink1Description: Digi-Key; ComponentLink1URL: https://www.digikey.com/product-detail/en/yageo/RC0603FR-074K7L/311-4-70KHRCT-ND/730159
R302 = Res_14k_0603-SMD_0.125W: RES 14kΩ ±1% 125mW 0805; Manufacturer: FOJAN; Manufacturer Part Number: FRC0805F1402TS; Supplier 1: LCSC; Supplier Part Number 1: FOJAN FRC0805F1402TS; Reel Stock: N/A; Last modified by: J.A.Oviedo; Last modified date: 20261021; ComponentLink1Description: LCSC; ComponentLink1URL: https://www.lcsc.com/es/product-detail/C2930168.html?s_z=n_q_t_resistor
R303 = Res_1k_0603_1/10W: RES SMD 1K OHM 1% 1/10W 0603; Manufacturer: Yageo; Manufacturer Part Number: RC0603FR-071KL; Supplier 1: Digi-Key; Supplier Part Number 1: 311-1.00KHRCT-ND; Reel Stock: N/A; Last modified by: J.Jaramillo; Last modified date: 20240310; ComponentLink1Description: Digi-Key; ComponentLink1URL: https://www.digikey.com/product-detail/en/yageo/RC0603FR-071KL/311-1-00KHRCT-ND/729790
R304 = Res_100k_0603_1/10W: as R200 on sheet 200_DC-DC; Supplier 1: Digi-Key; Supplier Part Number 1: RMCF0603FT100KCT-ND; Reel Stock: N/A; Last modified by: J.Jaramillo; Last modified date: 20240310; ComponentLink1Description: Digi-Key; ComponentLink1URL: https://www.digikey.com/product-detail/en/stackpole-electronics-inc/RMCF0603FT100K/RMCF0603FT100KCT-ND/1943118
R305 = Res_10k_0603_1/10W: as R201 on sheet 200_DC-DC; ComponentLink1URL: https://www.digikey.com/products/en?keywords=1276-3485-1-ND; Supplier 1: Digi-Key; Supplier Part Number 1: 1276-3485-1-ND; Reel Stock: N/A; Last modified by: J.Jaramillo; Last modified date: 20240310; ComponentLink1Description: Digi-key
R306 = Res_2k2_0603_1/10W: RES SMD 2.2K OHM 1% 1/10W 0603; Manufacturer: Yageo; Manufacturer Part Number: RC0603FR-072K2L; Reel Stock: N/A; Last modified by: J.Jaramillo; Last modified date: 20240310; ComponentLink1Description: Digi-Key; ComponentLink1URL: https://www.digikey.com/en/products/detail/yageo/RC0603FR-072K2L/727016?s=N4IgTCBcDaIEoGEAMA2JBmAYnAtEg7GANJgAyIAugL5A; Supplier 1: Digi-Key; Supplier Part Number 1: 311-2.20KHRCT-ND
T301 T302 = TP_SMD_45mil: Test point 45mil pad size; Last modified by: J.Jaramillo; Last modified date: 20240310
U300 = DC/DC_ADJ_-12V_3.5A_SOIC-8-EP: 60V Input, 3.5A Output Step-Down DC-DC Converter; Manufacturer: TI; Manufacturer Part Number: TPS54360DDAR; Reel Stock: N/A; Last modified by: J.A.Oviedo; Last modified date: 2026/10/21; ComponentLink1Description: LCLS; ComponentLink1URL: https://www.lcsc.com/es/product-detail/C44377.html?s_z=n_q_TPS54360; ComponentLink2Description: DATASHEET; ComponentLink2URL: https://www.lcsc.com/datasheet/C44377.pdf; Supplier 1: Mouser; Supplier Part Number 1: 595-TPS54360DDAR
U301 = DC/DC_ADJ_5A_SOIC-8-EP: as U200 on sheet 200_DC-DC; Manufacturer Part Number: SY8205FCC; Supplier 1: LCSC; Supplier Part Number 1: C111875; Reel Stock: N/A; Last modified by: J.A.OVIEDO; Last modified date: 20261018; ComponentLink1Description: LCSC; ComponentLink1URL: https://www.lcsc.com/es/product-detail/C111875.html?s_z=n_q_SY8205FCC; ComponentLink2Description: DATASHEET; ComponentLink2URL: https://www.lcsc.com/datasheet/C111875.pdf

## Sheet 400_DC-DC_Part3.SchDoc: *DC-DC Convertion stage
size A4; Date: xxxxxx; DrawnBy: J.A.Oviedo; Revision: R1V1; SheetNumber: 5; SheetTotal: 5
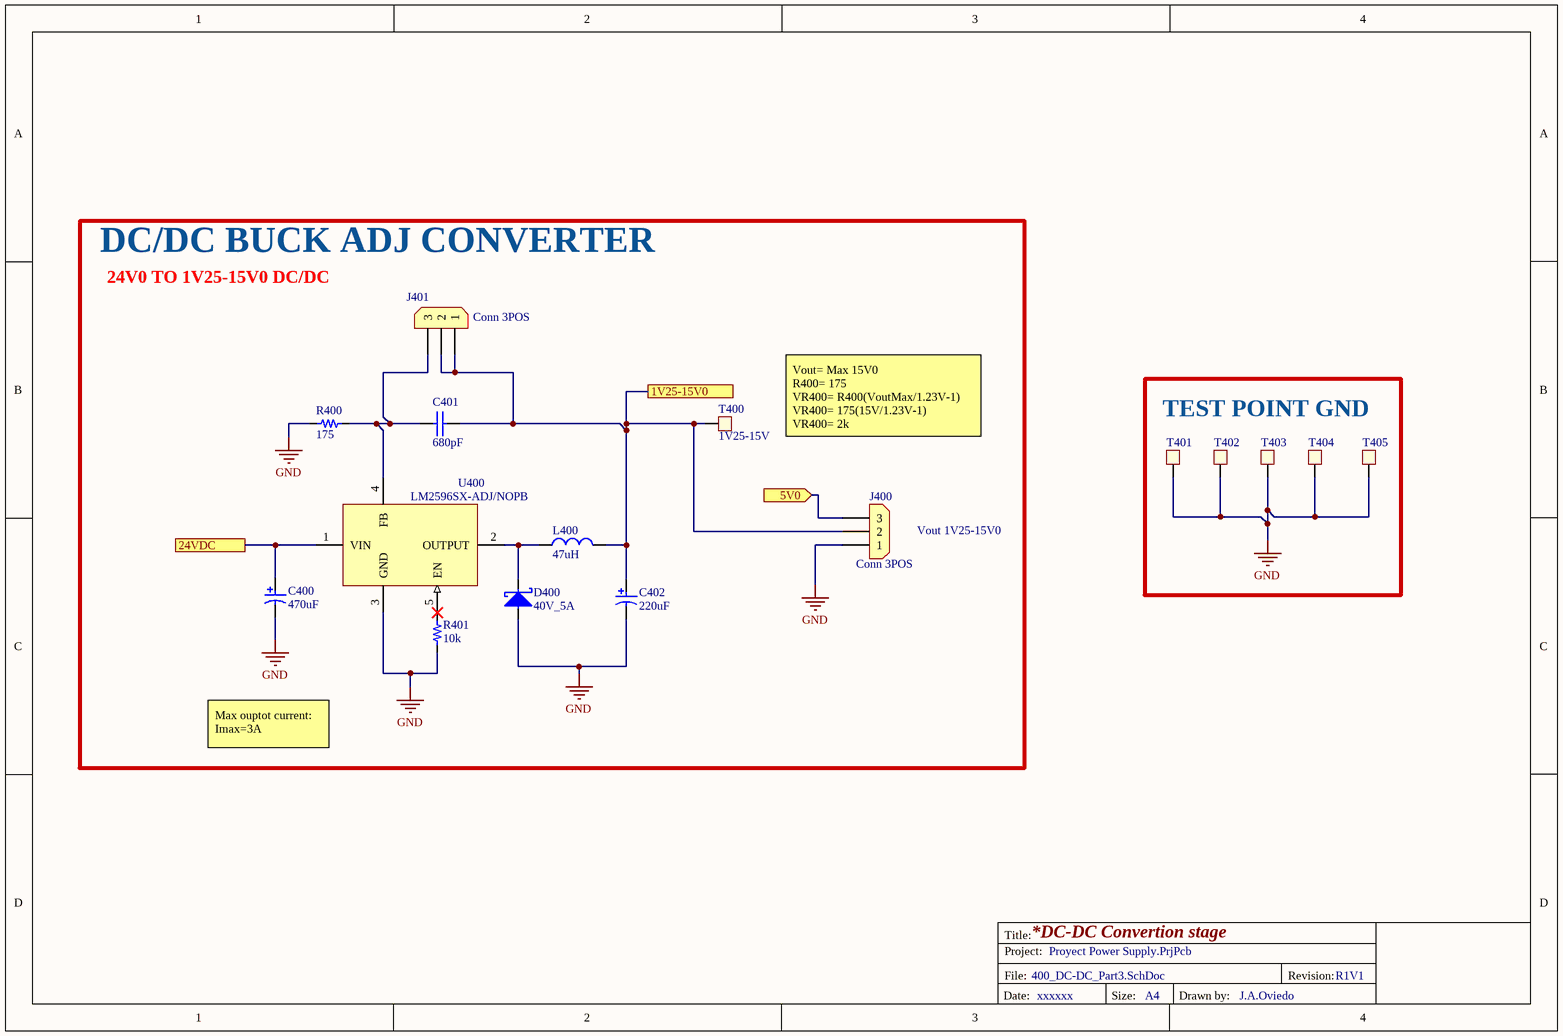
[diagram p4: 400_DC-DC_Part3.SchDoc]

### Parts
C400  value 470uF  [SMD_16*16*16]  (hidden comment: 470uF_50V)
C401  value 680pF  [0603]  (hidden comment: 680pF 50V)
C402  value 220uF  [RADIAL-CAN-SMD_Diax8mm_Hx10.2mm]  (hidden comment: 100uF 20%)
D400  40V_5A  [D_40V_5A_DO-214AC_Schottky]
J400  Conn 3POS  [CON_3x1_TH_5mm]
J401  Conn 3POS  [CON_3x1_TH_5mm]
L400  value 47uH  [L_47uH_5A_SMD_17.15x17]  (hidden comment: 47uH_5A)
R400  value 175  [Res_175_SMD-1206_2W]  (hidden comment: 175_2W)
R401  value 10k  [0603]  (hidden comment: 10k 1/10W)
T400  1V25-15V  [TP_SMD_45mil]  (no BOM)
T401  GND  [TP_SMD_45mil]  (value not drawn)  (no BOM)
T402  GND  [TP_SMD_45mil]  (value not drawn)  (no BOM)
T403  GND  [TP_SMD_45mil]  (value not drawn)  (no BOM)
T404  GND  [TP_SMD_45mil]  (value not drawn)  (no BOM)
T405  GND  [TP_SMD_45mil]  (value not drawn)  (no BOM)
U400  LM2596SX-ADJ/NOPB  [DPAK170P1435X457-6N]

### Blocks framed on the sheet
DC/DC BUCK ADJ CONVERTER: C400-C402 D400 J400 J401 L400 R400 R401 T400 U400
TEST POINT GND: T401-T405

### Ports
1V25-15V0 (see 000_Hierarchical[4C]), 5V0 (in, see 000_Hierarchical[3C], 200_DC-DC[4C]), 24VDC (see 000_Hierarchical[3D], 100_AC-DC[4B], 200_DC-DC[1A], 300_DC-DC_Part2[1A])

### Nets
GND: C400.2 C402.2 D400.2 J400.1 R400.1 R401.1 T401.1 T402.1 T403.1 T404.1 T405.1 U400.3(GND)
5V0: J400.3 ; port 5V0
NetC104_1: C400.1 U400.1(VIN) ; port 24VDC
NetC401_1: C401.1 J401.3 R400.2 U400.4(FB)
NetC401_2: C401.2 C402.1 J400.2 J401.1 J401.2 L400.2 T400.1 ; port 1V25-15V0
NetD400_1: D400.1 L400.1 U400.2(OUTPUT)
NetR401_2: R401.2 U400.5(EN)

### Notes on the sheet
- 24V0 TO 1V25-15V0 DC/DC
- Vout= Max 15V0                                       R400= 175                                            VR400= R400(VoutMax/1.23V-1)
  VR400= 175(15V/1.23V-1)    VR400= 2k
- (near J400) Vout 1V25-15V0
- Max ouptot current: Imax=3A
- Title:
- Project:
- File:
- Revision:
- Date:
- Size:
- A4
- Drawn by:

### Library data of the parts
C400 = Cap_470uF_ALU_SMD-16*16*16: CAP ALUM 470UF 20% 50V SMD; Manufacturer: Vishay Beyschlag/Draloric/BC Components; Manufacturer Part Number: MAL214699108E3; Supplier 1: Digi-Key; Supplier Part Number 1: 4442PHCT-ND; Last modified by: J.A.Oviedo; Last modified date: 20261021; ComponentLink1Description: Digi-Key; ComponentLink1URL: https://www.digikey.com/en/products/detail/rubycon/50TZV100M8X10-5/3134931
C401 = Cap_680pF_0603_50V: as C303 on sheet 300_DC-DC_Part2; Supplier 1: Digi-Key; Supplier Part Number 1: 399-C0603C681K5RAC7867CT-ND; Last modified by: J.Jaramillo; Last modified date: 20240309; ComponentLink1Description: Digi-Key; ComponentLink1URL: https://www.digikey.com/en/products/detail/kemet/C0603C681K5RAC7867/411079
C402 = Cap_220uF_35V_ALU_SMD: CAP ALUM 220uF ±20% 35V SMD; Manufacturer: ROQANG; Manufacturer Part Number: RVT1V221M0810; Supplier 1: LCSC; Supplier Part Number 1: C72498; Reel stock: N/A; Last modified by: J.Jaramillo; Last modified date: 270326; ComponentLink1Description: LCSC; ComponentLink1URL: https://www.lcsc.com/product-detail/C72498.html?s_z=n_C72498; ComponentLink2Description: Datasheet; ComponentLink2URL: https://www.lcsc.com/product-detail/C72498.html?s_z=n_C72498
D400 = D_40V_5A_DO-214AC_Schottky: DIODE SCHOTTKY 40V 5A DO214AC; Manufacturer: MCC (Micro Commercial Components); Manufacturer Part Number: SK54A-LTP; Reel Stock: N/A; Last modified by: J.Jaramillo; Last modified date: 20240310; Supplier 1: Digi-Key; Supplier Part Number 1: SK54A-LTPMSCT-ND; ComponentLink1Description: Digi-Key; ComponentLink1URL: https://www.digikey.com/products/en?keywords=1655-1896-1-ND
J400 J401 = Con_3x1_TH_5.0mm: TERM BLK 3POS SIDE ENTRY 5MM PCB; Manufacturer: Phoenix Contact; Manufacturer Part Number: 1935174; Supplier 1: Digi-Key; Supplier Part Number 1: 277-1578-ND; Reel Stock: N/A; Last modified by: J.Jaramillo; Last modified date: 20240310; ComponentLink1Description: Digi-Key; ComponentLink1URL: https://www.digikey.com/product-detail/en/phoenix-contact/1935174/277-1578-ND/568615
L400 = L_47uH_5A_SMD_17.15x17: FIXED IND 47UH 5A 108.46 MOHM; Manufacturer: Vishay Dale; Manufacturer Part Number: IHLP6767DZER470M11; Supplier 1: Digi-Key; Supplier Part Number 1: 541-1345-1-ND; Reel Stock: N/A; Last modified date: 20261021
R400 = Res_175_SMD-1206_2W: Manufacturer: Vishay Dale Thin Film; Manufacturer Part Number: PCAN1206E1750BST5; Supplier 1: Digi-key; Supplier Part Number 1: 764-1138-1-ND; Reel Stock: N/A; Last modified by: J.A.Oviedo; Last modified date: 20261021
R401 = Res_10k_0603_1/10W: as R201 on sheet 200_DC-DC; ComponentLink1URL: https://www.digikey.com/products/en?keywords=1276-3485-1-ND; Supplier 1: Digi-Key; Supplier Part Number 1: 1276-3485-1-ND; Reel Stock: N/A; Last modified by: J.Jaramillo; Last modified date: 20240310; ComponentLink1Description: Digi-key
T400-T405 = TP_SMD_45mil: Test point 45mil pad size; Last modified by: J.Jaramillo; Last modified date: 20240310
U400 = DCDC_1.25/15V_3A_TO-263-5: LM2596 SIMPLE SWITCHER 3A Step-Down Voltage Regulator; Manufacturer: TI; Manufacturer Part Number: LM2596SX-ADJ/NOPB; Supplier 1: LCSC; Supplier Part Number 1: C29781; Reel Stock: N/A; Last modified by: J.A.Oviedo; Last modified date: 20261020; ComponentLink1Description: LCSC; ComponentLink1URL: https://www.lcsc.com/es/product-detail/C29781.html?s_z=n_q_t_LM2596; ComponentLink2Description: DATASHEET; ComponentLink2URL: https://www.lcsc.com/datasheet/C29781.pdf

## Nets that join several sheets
GND: 000_Hierarchical (5 pins), 100_AC-DC (8 pins), 200_DC-DC (12 pins), 300_DC-DC_Part2 (10 pins), 400_DC-DC_Part3 (12 pins)
5V0: 000_Hierarchical (J2.1), 200_DC-DC (5 pins), 400_DC-DC_Part3 (J400.3)
NetC104_1: 100_AC-DC (5 pins), 200_DC-DC (8 pins), 300_DC-DC_Part2 (7 pins), 400_DC-DC_Part3 (C400.1 U400.1)
NetC204_1: 000_Hierarchical (J1.1), 200_DC-DC (5 pins)
NetC305_2: 000_Hierarchical (J3.1), 300_DC-DC_Part2 (C305.2 D300.2 R303.1 T301.1)
NetC310_1: 000_Hierarchical (J4.1), 300_DC-DC_Part2 (5 pins)
NetC401_2: 000_Hierarchical (J5.1), 400_DC-DC_Part3 (7 pins)